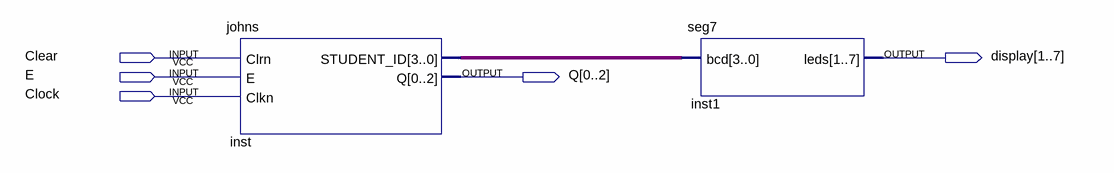
[diagram p0: schematic sheet]
// Quartus schematic JOHN.bdf as structural Verilog: 2 symbols, 5 pins
module JOHN (
  input  Clear,
  input  E,
  input  Clock,
  output [1:7] display,
  output [0:2] Q
);

  wire [3:0] inst_student_id;

  johns inst (.Clrn(Clear), .E(E), .Clkn(Clock), .STUDENT_ID(inst_student_id), .Q(Q));
  seg7 inst1 (.bcd(inst_student_id), .leds(display));
endmodule
